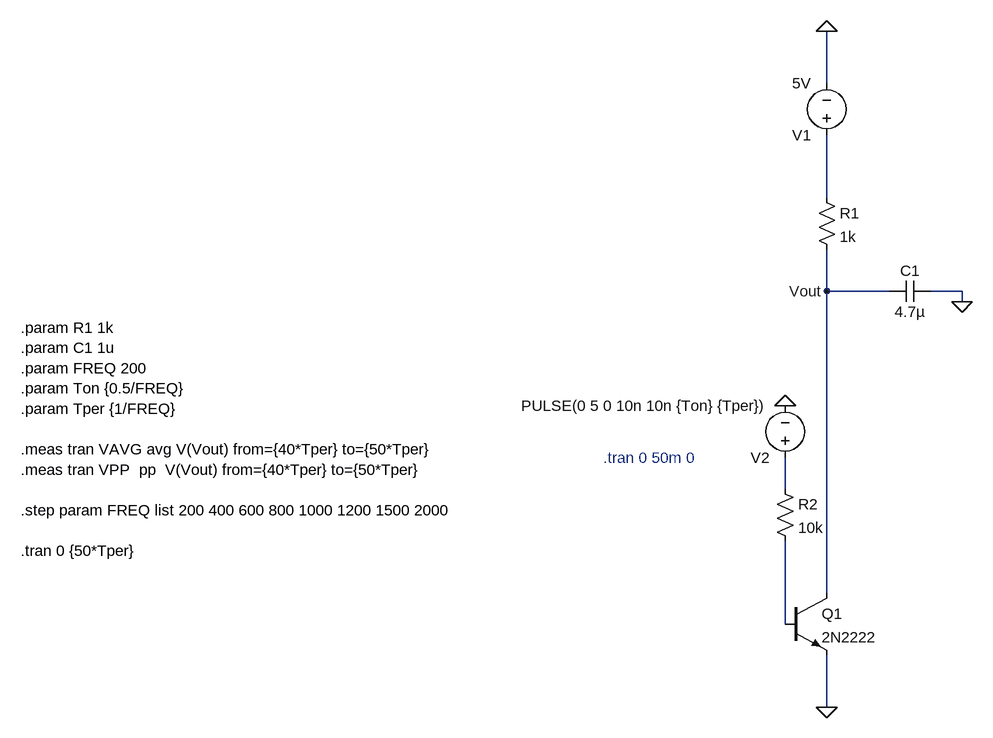
[diagram p0: schematic Draft1.asc]
Draft1.asc, the LTspice schematic file:
Version 4.1
SHEET 1 880 680
WIRE -304 -320 -304 -400
WIRE -304 -144 -304 -240
WIRE -304 0 -304 -64
WIRE -208 0 -304 0
WIRE -96 0 -144 0
WIRE -96 16 -96 0
WIRE -368 304 -368 256
WIRE -304 464 -304 0
WIRE -368 512 -368 384
WIRE -304 640 -304 560
FLAG -304 640 0
FLAG -96 16 0
FLAG -304 0 Vout
FLAG -304 -400 0
FLAG -368 176 0
SYMBOL res -384 288 R0
SYMATTR InstName R2
SYMATTR Value 10k
SYMBOL voltage -304 -224 R180
WINDOW 123 0 0 Left 0
WINDOW 39 0 0 Left 0
SYMATTR InstName V1
SYMATTR Value 5V
SYMBOL voltage -368 272 R180
WINDOW 123 0 0 Left 0
WINDOW 39 0 0 Left 0
SYMATTR InstName V2
SYMATTR Value PULSE(0 5 0 10n 10n {Ton} {Tper})
SYMBOL res -320 -160 R0
SYMATTR InstName R1
SYMATTR Value 1k
SYMBOL cap -144 -16 R90
WINDOW 0 0 32 VBottom 2
WINDOW 3 32 32 VTop 2
SYMATTR InstName C1
SYMATTR Value 4.7µ
SYMBOL npn -368 464 R0
SYMATTR InstName Q1
SYMATTR Value 2N2222
TEXT -648 256 Left 2 ;.tran 0 50m 0
TEXT -1544 56 Left 2 !.param R1 1k\n.param C1 1u\n.param FREQ 200\n.param Ton {0.5/FREQ}\n.param Tper {1/FREQ}\n \n.meas tran VAVG avg V(Vout) from={40*Tper} to={50*Tper}\n.meas tran VPP  pp  V(Vout) from={40*Tper} to={50*Tper}\n \n.step param FREQ list 200 400 600 800 1000 1200 1500 2000\n \n.tran 0 {50*Tper}

The netlist it stands for:
* Draft1.asc
R2 N002 N003 10k
V1 N001 0 5V
V2 N002 0 PULSE(0 5 0 10n 10n {Ton} {Tper})
R1 N001 Vout 1k
C1 0 Vout 4.7µ
Q1 Vout N003 0 0 2N2222
.model NPN NPN
.model PNP PNP
.lib standard.bjt
* .tran 0 50m 0
.param R1 1k
.param C1 1u
.param FREQ 200
.param Ton {0.5/FREQ}
.param Tper {1/FREQ}
.meas tran VAVG avg V(Vout) from={40*Tper} to={50*Tper}
.meas tran VPP  pp  V(Vout) from={40*Tper} to={50*Tper}
.step param FREQ list 200 400 600 800 1000 1200 1500 2000
.tran 0 {50*Tper}
.backanno
.end

* Results of the author's LTspice run, read from the files saved beside the schematic
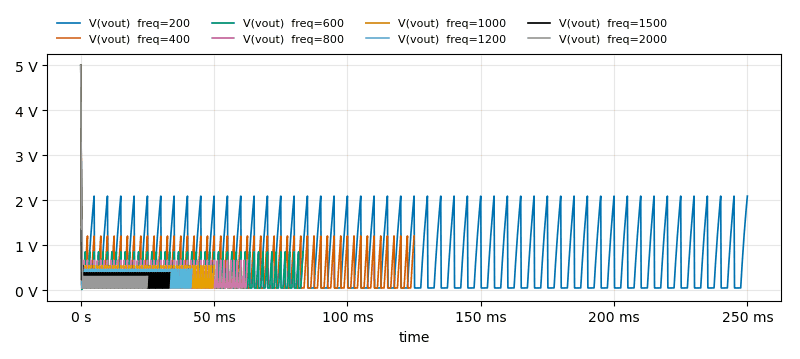
[diagram p1: Transient Analysis of Draft1.asc, plotted from the saved traces]
* Transient Analysis, 8 runs:
*   V(vout) [freq=200]: min 47.28 mV, max 5 V, average 636 mV, rms 951 mV, last 2.091 V
*   V(vout) [freq=400]: min 47.28 mV, max 5 V, average 375.7 mV, rms 557.1 mV, last 1.204 V
*   V(vout) [freq=600]: min 14.01 mV, max 5 V, average 279.4 mV, rms 423.3 mV, last 851.8 mV
*   V(vout) [freq=800]: min 46.06 mV, max 5 V, average 230.5 mV, rms 367.1 mV, last 663.7 mV
*   V(vout) [freq=1000]: min 47.28 mV, max 5 V, average 201.6 mV, rms 344.1 mV, last 546.9 mV
*   V(vout) [freq=1200]: min 47.28 mV, max 5 V, average 183.3 mV, rms 338.7 mV, last 467.2 mV
*   V(vout) [freq=1500]: min 47.28 mV, max 5 V, average 168.3 mV, rms 345.4 mV, last 386.1 mV
*   V(vout) [freq=2000]: min 47.28 mV, max 5 V, average 166.4 mV, rms 397.8 mV, last 303.6 mV
* From the log:
*   Measurement: VAVG
*     step  AVG(V(Vout))  FROM  TO
*        1  0.633187261299  0.2  0.25
*        2  0.369329181713  0.1  0.125
*        3  0.269558824617  0.0666666666667  0.0833333333333
*        4  0.217247356904  0.05  0.0625
*        5  0.18495528419  0.04  0.05
*        6  0.163228534114  0.0333333333333  0.0416666666667
*        7  0.141336207176  0.0266666666667  0.0333333333333
*        8  0.119379662199  0.02  0.025
*   Measurement: VPP
*     step  PP(V(Vout))  FROM  TO
*        1  2.04328215495  0.2  0.25
*        2  1.15648416057  0.1  0.125
*        3  0.804542776197  0.0666666666667  0.0833333333333
*        4  0.616524536163  0.05  0.0625
*        5  0.499646559358  0.04  0.05
*        6  0.419985748827  0.0333333333333  0.0416666666667
*        7  0.338901061565  0.0266666666667  0.0333333333333
*        8  0.256366156042  0.02  0.025